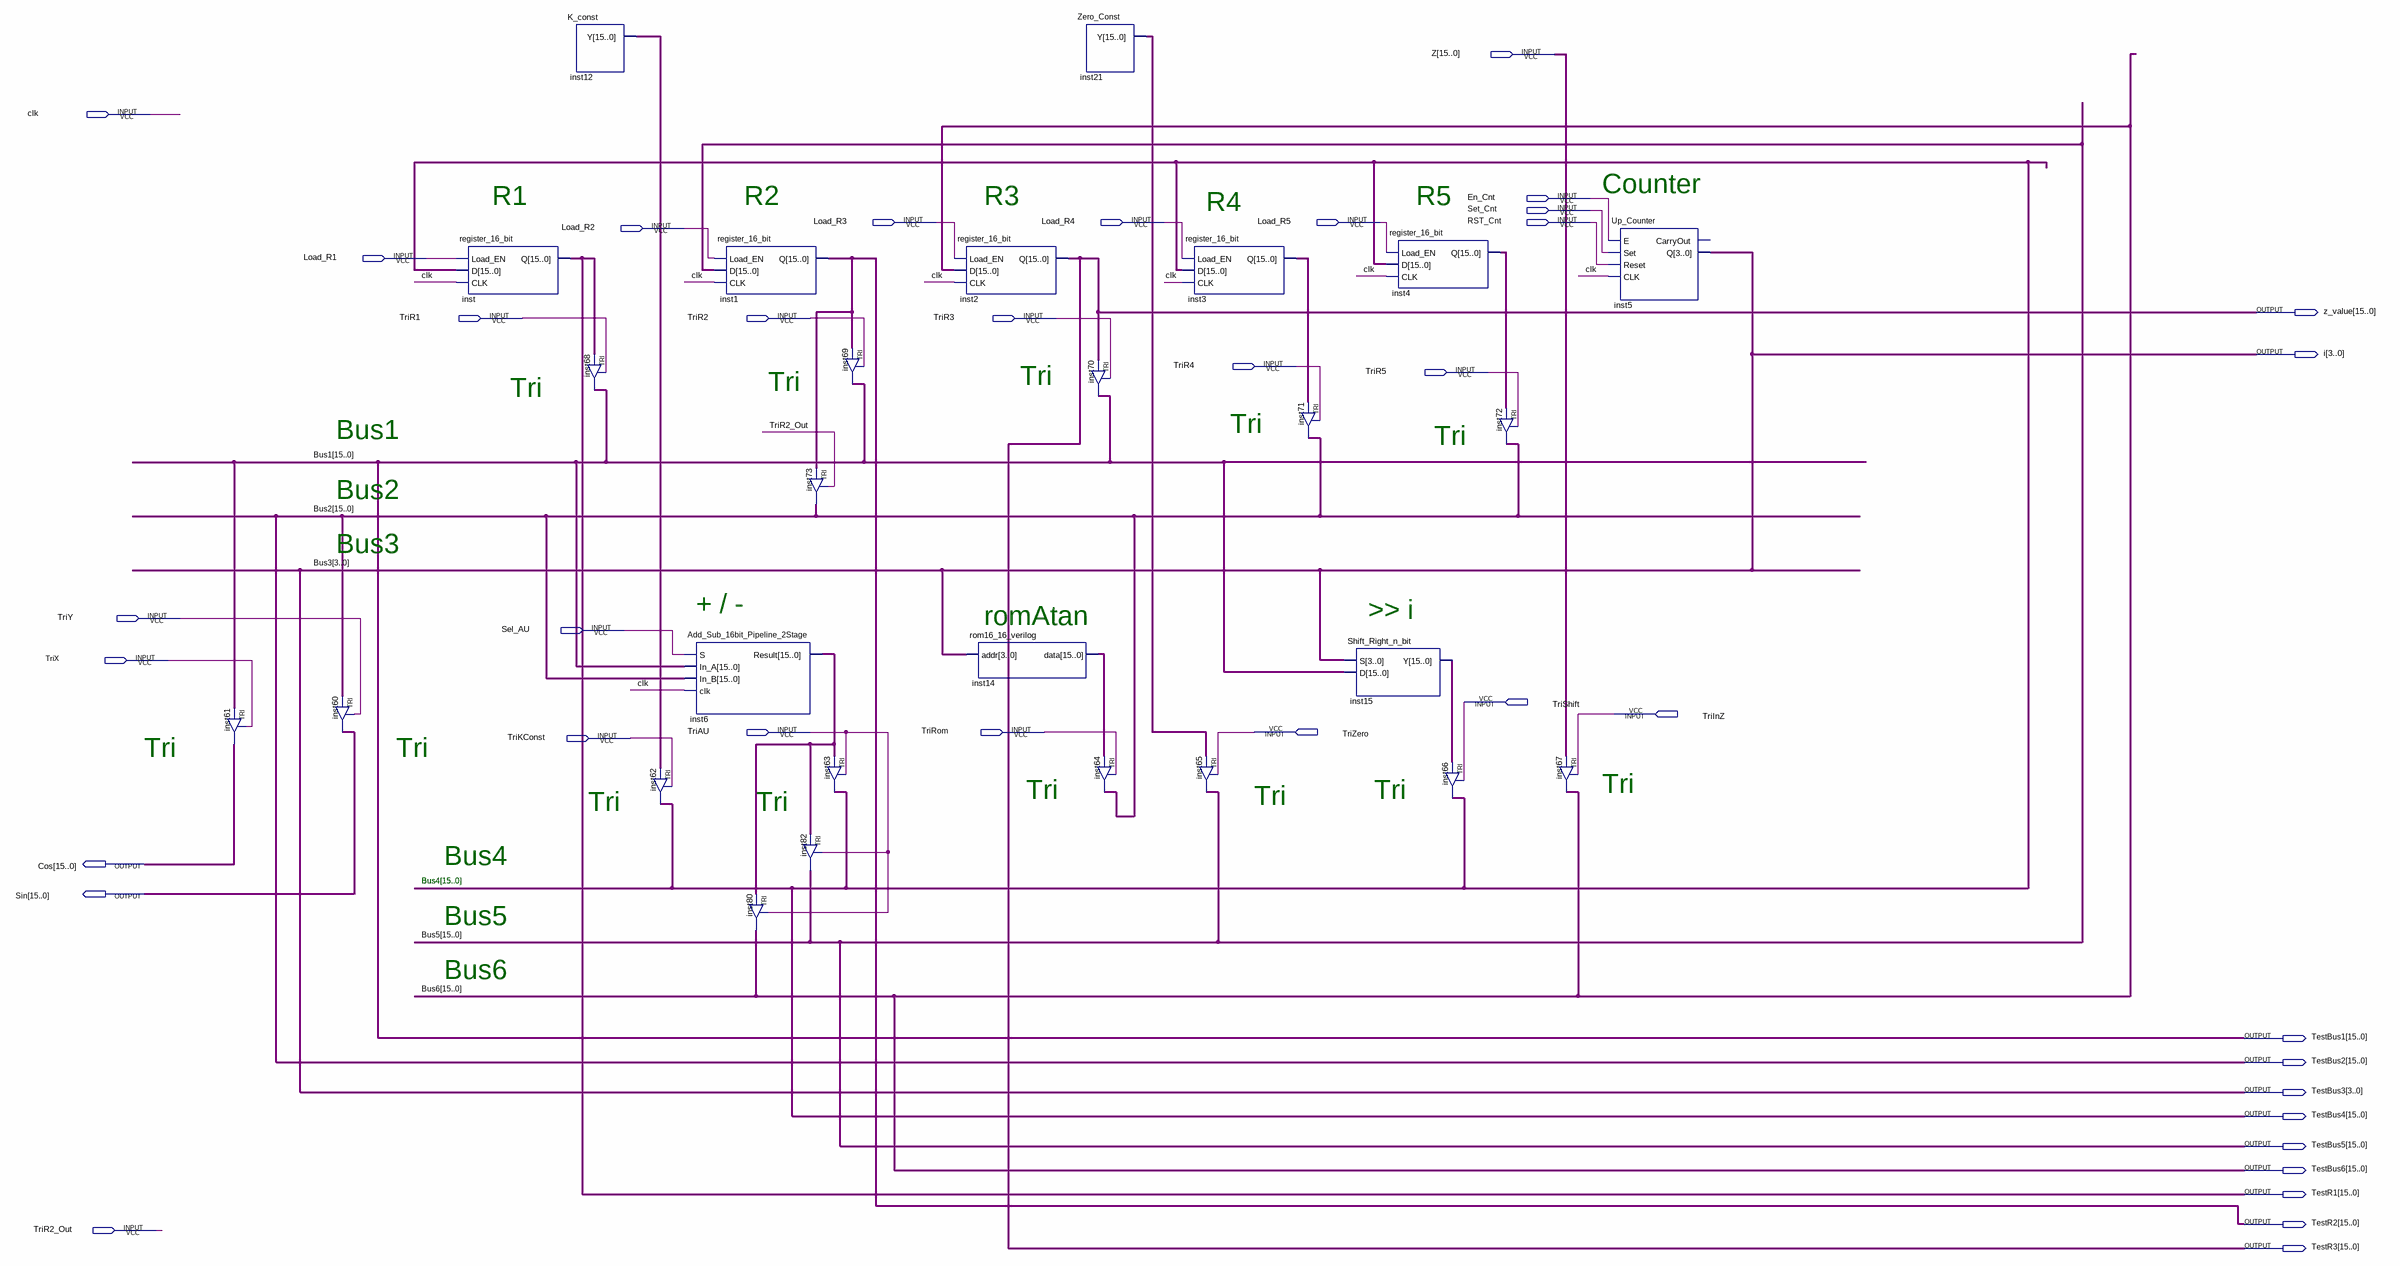
[diagram p0: schematic sheet]
// Quartus schematic datapath_ver1.bdf as structural Verilog: 27 symbols, 38 pins
module datapath_ver1 (
  input  [15:0] Z,
  input  clk,
  input  En_Cnt,
  input  Set_Cnt,
  input  Load_R3,
  input  Load_R4,
  input  Load_R5,
  input  RST_Cnt,
  input  Load_R2,
  input  Load_R1,
  input  TriR1,
  input  TriR2,
  input  TriR3,
  input  TriR4,
  input  TriR5,
  input  TriY,
  input  Sel_AU,
  input  TriX,
  input  TriShift,
  input  TriInZ,
  input  TriAU,
  input  TriRom,
  input  TriZero,
  input  TriKConst,
  input  TriR2_Out,
  output [15:0] z_value,
  output [3:0] i,
  output [15:0] Cos,
  output [15:0] Sin,
  output [15:0] TestBus1,
  output [15:0] TestBus2,
  output [3:0] TestBus3,
  output [15:0] TestBus4,
  output [15:0] TestBus5,
  output [15:0] TestBus6,
  output [15:0] TestR1,
  output [15:0] TestR2,
  output [15:0] TestR3
);

  wire [15:0] inst3_q, inst4_q, inst6_result, inst12_y, inst14_data, inst15_y, inst21_y;

  TRI inst61[15:0] (.IN(TestBus1), .OE(TriX), .OUT(Cos));
  TRI inst60[15:0] (.IN(TestBus2), .OE(TriY), .OUT(Sin));
  register_16_bit inst (.Load_EN(Load_R1), .D(TestBus4), .CLK(clk), .Q(TestR1));
  K_const inst12 (.Y(inst12_y));
  TRI inst68[15:0] (.IN(TestR1), .OE(TriR1), .OUT(TestBus1));
  TRI inst62[15:0] (.IN(inst12_y), .OE(TriKConst), .OUT(TestBus4));
  register_16_bit inst1 (.Load_EN(Load_R2), .D(TestBus5), .CLK(clk), .Q(TestR2));
  Add_Sub_16bit_Pipeline_2Stage inst6 (.S(Sel_AU), .In_A(TestBus1), .In_B(TestBus2), .clk(clk), .Result(inst6_result));
  TRI inst80[15:0] (.IN(inst6_result), .OE(TriAU), .OUT(TestBus6));
  TRI inst73[15:0] (.IN(TestR2), .OE(TriR2_Out), .OUT(TestBus2));
  TRI inst63[15:0] (.IN(inst6_result), .OE(TriAU), .OUT(TestBus4));
  TRI inst82[15:0] (.IN(inst6_result), .OE(TriAU), .OUT(TestBus5));
  TRI inst69[15:0] (.IN(TestR2), .OE(TriR2), .OUT(TestBus1));
  register_16_bit inst2 (.Load_EN(Load_R3), .D(TestBus6), .CLK(clk), .Q(TestR3));
  rom16_16_verilog inst14 (.addr(i), .data(inst14_data));
  Zero_Const inst21 (.Y(inst21_y));
  TRI inst70[15:0] (.IN(TestR3), .OE(TriR3), .OUT(TestBus1));
  TRI inst64[15:0] (.IN(inst14_data), .OE(TriRom), .OUT(TestBus2));
  register_16_bit inst3 (.Load_EN(Load_R4), .D(TestBus4), .CLK(clk), .Q(inst3_q));
  TRI inst65[15:0] (.IN(inst21_y), .OE(TriZero), .OUT(TestBus5));
  TRI inst71[15:0] (.IN(inst3_q), .OE(TriR4), .OUT(TestBus2));
  Shift_Right_n_bit inst15 (.S(i), .D(TestBus1), .Y(inst15_y));
  register_16_bit inst4 (.Load_EN(Load_R5), .D(TestBus4), .CLK(clk), .Q(inst4_q));
  TRI inst66[15:0] (.IN(inst15_y), .OE(TriShift), .OUT(TestBus4));
  TRI inst72[15:0] (.IN(inst4_q), .OE(TriR5), .OUT(TestBus2));
  TRI inst67[15:0] (.IN(Z), .OE(TriInZ), .OUT(TestBus6));
  Up_Counter inst5 (.E(En_Cnt), .Set(Set_Cnt), .Reset(RST_Cnt), .CLK(clk), .Q(i));  // open: CarryOut

  assign TestBus3 = i;
  assign z_value = TestR3;

  // Other names for the same wires on the sheet: Bus1[15:0] = TestBus1; Bus5[15:0] = TestBus5; Bus6[15:0] = TestBus6;
  //   Bus3[3:0] = i; Bus2[15:0] = TestBus2; Bus4[15:0] = TestBus4

  // Notes on the sheet:
  //   Counter
  //   R1
  //   R2
  //   R3
  //   R5
  //   R4
  //   Tri
  //   Tri
  //   Tri
  //   Tri
  //   Bus1
  //   Tri
  //   Bus2
  //   Bus3
  //   + / -
  //   >> i
  //   romAtan
  //   Tri
  //   Tri
  //   Tri
  //   Tri
  //   Tri
  //   Tri
  //   Tri
  //   Tri
  //   Bus4
  //   Bus4[15..0]
  //   Bus5
  //   Bus6
endmodule
